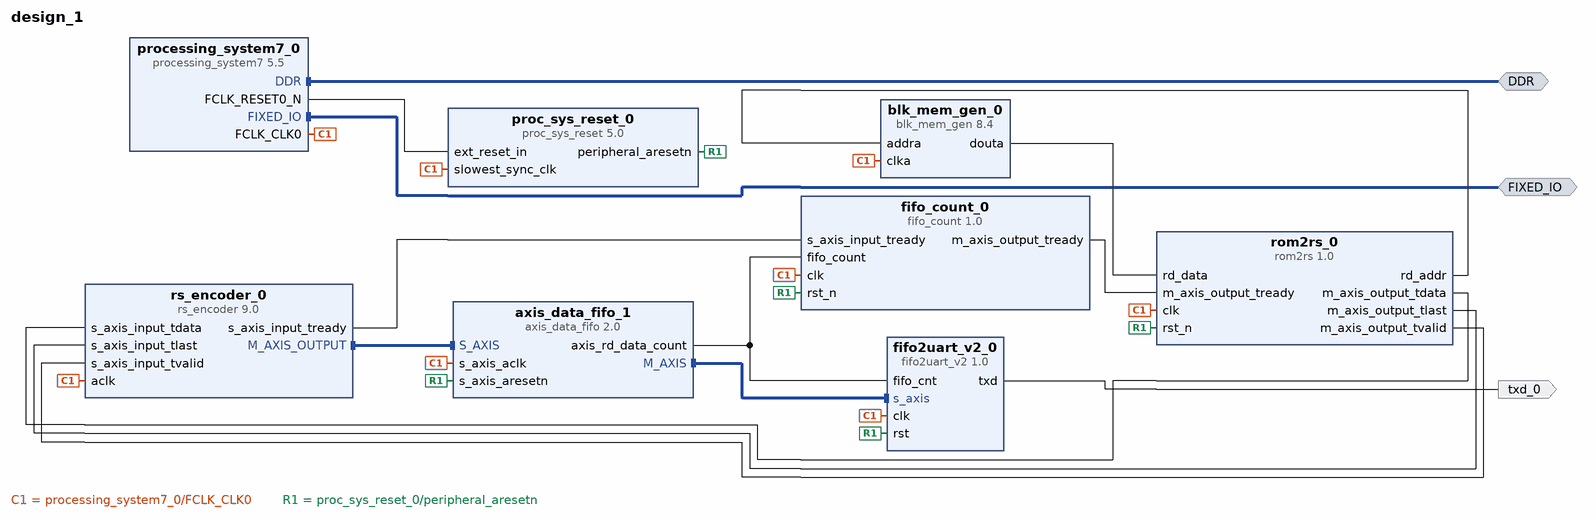
[diagram p0: block diagram of the top level]
# Vivado block design design_1, xc7z010clg400-1, Vivado 2020.2
create_bd_design design_1

create_bd_intf_port -mode Master -vlnv xilinx.com:interface:ddrx_rtl:1.0 DDR
create_bd_intf_port -mode Master -vlnv xilinx.com:display_processing_system7:fixedio_rtl:1.0 FIXED_IO
create_bd_port -dir O txd_0

create_bd_cell -type ip -vlnv xilinx.com:ip:blk_mem_gen:8.4 blk_mem_gen_0
set_property -dict [list \
  CONFIG.Coe_File ../../../../../../../data/tx/dds_239x8b_wave.coe \
  CONFIG.Enable_32bit_Address false \
  CONFIG.Enable_A Always_Enabled \
  CONFIG.Load_Init_File true \
  CONFIG.Memory_Type Single_Port_ROM \
  CONFIG.Port_A_Write_Rate 0 \
  CONFIG.Register_PortA_Output_of_Memory_Primitives false \
  CONFIG.Use_RSTA_Pin false \
  CONFIG.Write_Depth_A 240 \
  CONFIG.Write_Width_A 8 \
  CONFIG.use_bram_block Stand_Alone \
] [get_bd_cells blk_mem_gen_0]
create_bd_cell -type ip -vlnv xilinx.com:ip:rs_encoder:9.0 rs_encoder_0
set_property -dict {CONFIG.Output_has_Tready true CONFIG.aclken false CONFIG.aresetn false} [get_bd_cells rs_encoder_0]
create_bd_cell -type ip -vlnv xilinx.com:ip:processing_system7:5.5 processing_system7_0
set_property -dict [list \
  CONFIG.PCW_FCLK_CLK0_BUF FALSE \
  CONFIG.PCW_FPGA0_PERIPHERAL_FREQMHZ 200 \
  CONFIG.PCW_PRESET_BANK1_VOLTAGE {LVCMOS 1.8V} \
  CONFIG.PCW_QSPI_GRP_SINGLE_SS_ENABLE 1 \
  CONFIG.PCW_QSPI_GRP_SINGLE_SS_IO {MIO 1 .. 6} \
  CONFIG.PCW_QSPI_PERIPHERAL_ENABLE 1 \
  CONFIG.PCW_QSPI_QSPI_IO {MIO 1 .. 6} \
  CONFIG.PCW_SINGLE_QSPI_DATA_MODE x4 \
  CONFIG.PCW_UART0_PERIPHERAL_ENABLE 1 \
  CONFIG.PCW_UART0_UART0_IO {MIO 14 .. 15} \
  CONFIG.PCW_UART_PERIPHERAL_FREQMHZ 100 \
  CONFIG.PCW_UIPARAM_DDR_PARTNO {MT41K128M16 JT-125} \
  CONFIG.PCW_USE_M_AXI_GP0 0 \
] [get_bd_cells processing_system7_0]
# 61 more settings of processing_system7_0 are not shown: defaults, MIO pin electricals, DDR timing, and values the tool derives
create_bd_cell -type ip -vlnv xilinx.com:user:fifo_count:1.0 fifo_count_0
create_bd_cell -type ip -vlnv xilinx.com:ip:axis_data_fifo:2.0 axis_data_fifo_1
set_property -dict [list \
  CONFIG.FIFO_DEPTH 4096 \
  CONFIG.FIFO_MEMORY_TYPE auto \
  CONFIG.HAS_RD_DATA_COUNT 1 \
] [get_bd_cells axis_data_fifo_1]
create_bd_cell -type ip -vlnv xilinx.com:user:rom2rs:1.0 rom2rs_0
set_property -dict {CONFIG.CLK_FREQ 200000000} [get_bd_cells rom2rs_0]
create_bd_cell -type ip -vlnv xilinx.com:ip:proc_sys_reset:5.0 proc_sys_reset_0
set_property -dict {CONFIG.C_AUX_RESET_HIGH 0} [get_bd_cells proc_sys_reset_0]
create_bd_cell -type ip -vlnv xilinx.com:user:fifo2uart_v2:1.0 fifo2uart_v2_0
set_property -dict {CONFIG.BAUD_RATE 20000000 CONFIG.CLK_FREQ 200000000} [get_bd_cells fifo2uart_v2_0]

# ---- connections ----

connect_bd_intf_net [get_bd_intf_pins axis_data_fifo_1/M_AXIS] [get_bd_intf_pins fifo2uart_v2_0/s_axis]
connect_bd_intf_net [get_bd_intf_ports DDR] [get_bd_intf_pins processing_system7_0/DDR]
connect_bd_intf_net [get_bd_intf_pins rs_encoder_0/M_AXIS_OUTPUT] [get_bd_intf_pins axis_data_fifo_1/S_AXIS]
connect_bd_intf_net [get_bd_intf_ports FIXED_IO] [get_bd_intf_pins processing_system7_0/FIXED_IO]
connect_bd_net [get_bd_pins rom2rs_0/rd_addr] [get_bd_pins blk_mem_gen_0/addra]
connect_bd_net [get_bd_pins blk_mem_gen_0/douta] [get_bd_pins rom2rs_0/rd_data]
connect_bd_net [get_bd_pins rom2rs_0/m_axis_output_tdata] [get_bd_pins rs_encoder_0/s_axis_input_tdata]
connect_bd_net [get_bd_pins rom2rs_0/m_axis_output_tlast] [get_bd_pins rs_encoder_0/s_axis_input_tlast]
connect_bd_net [get_bd_pins rom2rs_0/m_axis_output_tvalid] [get_bd_pins rs_encoder_0/s_axis_input_tvalid]
connect_bd_net [get_bd_pins rs_encoder_0/s_axis_input_tready] [get_bd_pins fifo_count_0/s_axis_input_tready]
connect_bd_net [get_bd_pins fifo_count_0/m_axis_output_tready] [get_bd_pins rom2rs_0/m_axis_output_tready]
connect_bd_net [get_bd_pins axis_data_fifo_1/axis_rd_data_count] [get_bd_pins fifo_count_0/fifo_count] [get_bd_pins fifo2uart_v2_0/fifo_cnt]
connect_bd_net [get_bd_pins fifo2uart_v2_0/txd] [get_bd_ports txd_0]
connect_bd_net [get_bd_pins processing_system7_0/FCLK_CLK0] \
  [get_bd_pins proc_sys_reset_0/slowest_sync_clk] [get_bd_pins axis_data_fifo_1/s_axis_aclk] [get_bd_pins rs_encoder_0/aclk] \
  [get_bd_pins fifo_count_0/clk] [get_bd_pins rom2rs_0/clk] [get_bd_pins blk_mem_gen_0/clka] [get_bd_pins fifo2uart_v2_0/clk]
connect_bd_net [get_bd_pins processing_system7_0/FCLK_RESET0_N] [get_bd_pins proc_sys_reset_0/ext_reset_in]
connect_bd_net [get_bd_pins proc_sys_reset_0/peripheral_aresetn] \
  [get_bd_pins fifo_count_0/rst_n] [get_bd_pins axis_data_fifo_1/s_axis_aresetn] [get_bd_pins rom2rs_0/rst_n] \
  [get_bd_pins fifo2uart_v2_0/rst]

validate_bd_design
save_bd_design
